# Altium schematic sheet LED_Schematic.SchDoc
size A4; SheetNumber: 1; SheetTotal: 1
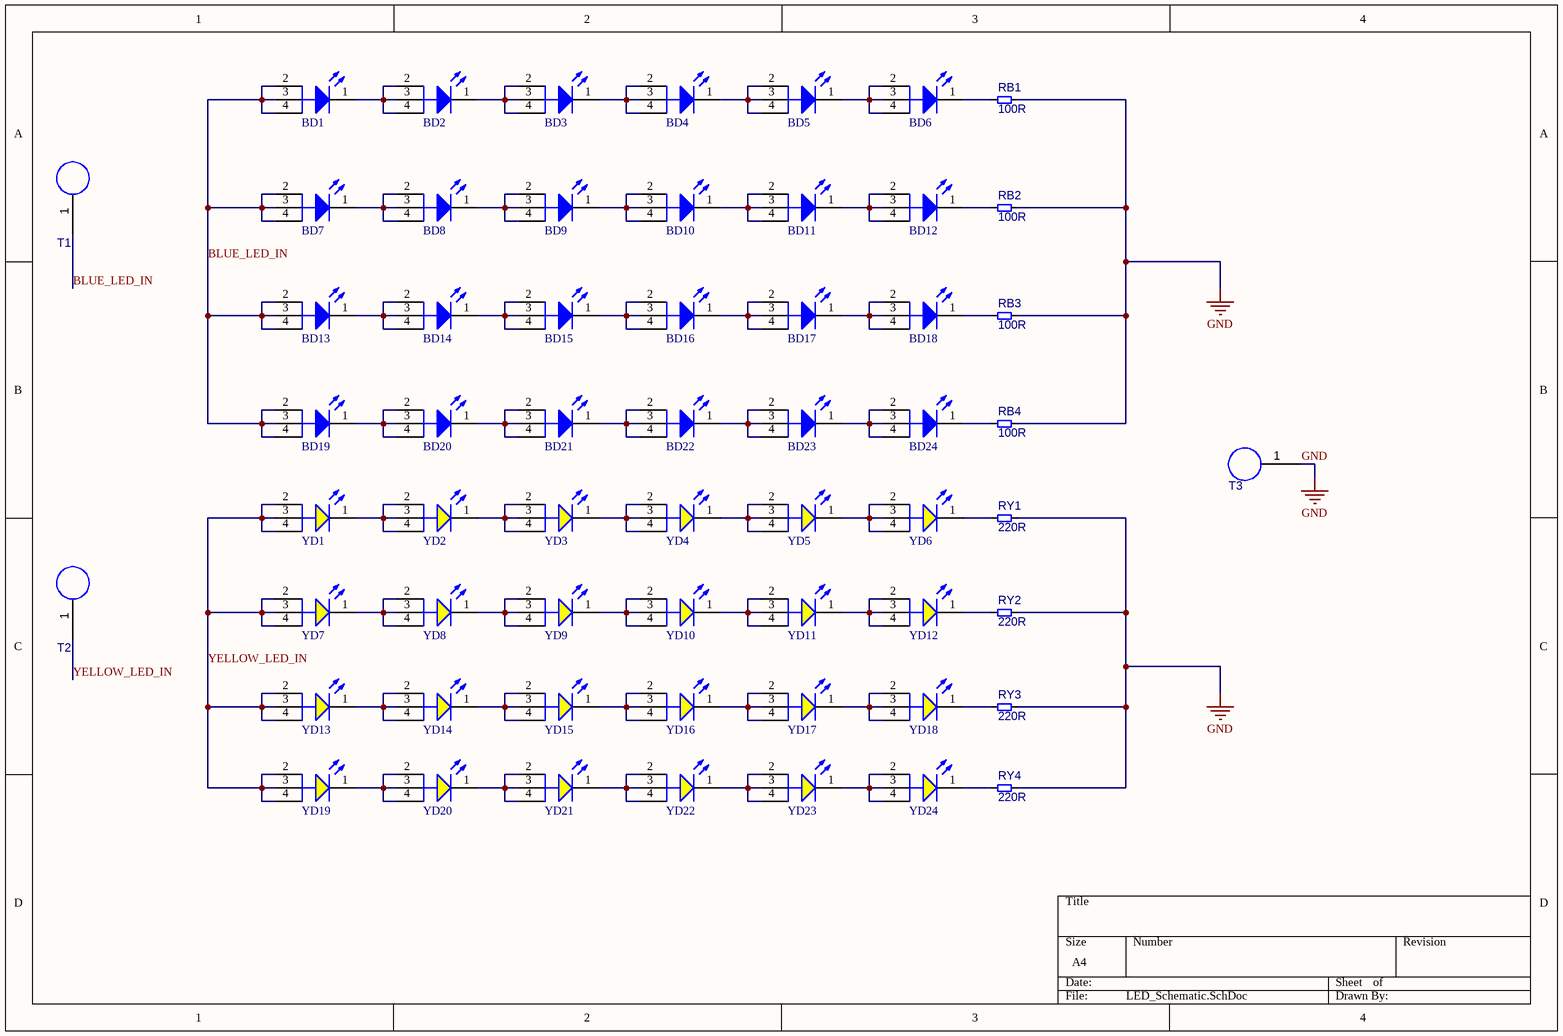
[diagram p0: LED_Schematic.SchDoc]

## Parts
BD1  Blue, 3.2V, 120°  [WL-SMTW_3528_LPCC 4]  (value not drawn)
BD2  Blue, 3.2V, 120°  [WL-SMTW_3528_LPCC 4]  (value not drawn)
BD3  Blue, 3.2V, 120°  [WL-SMTW_3528_LPCC 4]  (value not drawn)
BD4  Blue, 3.2V, 120°  [WL-SMTW_3528_LPCC 4]  (value not drawn)
BD5  Blue, 3.2V, 120°  [WL-SMTW_3528_LPCC 4]  (value not drawn)
BD6  Blue, 3.2V, 120°  [WL-SMTW_3528_LPCC 4]  (value not drawn)
BD7  Blue, 3.2V, 120°  [WL-SMTW_3528_LPCC 4]  (value not drawn)
BD8  Blue, 3.2V, 120°  [WL-SMTW_3528_LPCC 4]  (value not drawn)
BD9  Blue, 3.2V, 120°  [WL-SMTW_3528_LPCC 4]  (value not drawn)
BD10  Blue, 3.2V, 120°  [WL-SMTW_3528_LPCC 4]  (value not drawn)
BD11  Blue, 3.2V, 120°  [WL-SMTW_3528_LPCC 4]  (value not drawn)
BD12  Blue, 3.2V, 120°  [WL-SMTW_3528_LPCC 4]  (value not drawn)
BD13  Blue, 3.2V, 120°  [WL-SMTW_3528_LPCC 4]  (value not drawn)
BD14  Blue, 3.2V, 120°  [WL-SMTW_3528_LPCC 4]  (value not drawn)
BD15  Blue, 3.2V, 120°  [WL-SMTW_3528_LPCC 4]  (value not drawn)
BD16  Blue, 3.2V, 120°  [WL-SMTW_3528_LPCC 4]  (value not drawn)
BD17  Blue, 3.2V, 120°  [WL-SMTW_3528_LPCC 4]  (value not drawn)
BD18  Blue, 3.2V, 120°  [WL-SMTW_3528_LPCC 4]  (value not drawn)
BD19  Blue, 3.2V, 120°  [WL-SMTW_3528_LPCC 4]  (value not drawn)
BD20  Blue, 3.2V, 120°  [WL-SMTW_3528_LPCC 4]  (value not drawn)
BD21  Blue, 3.2V, 120°  [WL-SMTW_3528_LPCC 4]  (value not drawn)
BD22  Blue, 3.2V, 120°  [WL-SMTW_3528_LPCC 4]  (value not drawn)
BD23  Blue, 3.2V, 120°  [WL-SMTW_3528_LPCC 4]  (value not drawn)
BD24  Blue, 3.2V, 120°  [WL-SMTW_3528_LPCC 4]  (value not drawn)
RB1  Resistance: 100R  [2010 (5025)]  (hidden comment: Resistor)
RB2  Resistance: 100R  [2010 (5025)]  (hidden comment: Resistor)
RB3  Resistance: 100R  [2010 (5025)]  (hidden comment: Resistor)
RB4  Resistance: 100R  [2010 (5025)]  (hidden comment: Resistor)
RY1  Resistance: 220R  [2010 (5025)]  (hidden comment: Resistor)
RY2  Resistance: 220R  [2010 (5025)]  (hidden comment: Resistor)
RY3  Resistance: 220R  [2010 (5025)]  (hidden comment: Resistor)
RY4  Resistance: 220R  [2010 (5025)]  (hidden comment: Resistor)
T1  Testpoint_1  [Testpoint_1mm]  (value not drawn)  (no BOM)
T2  Testpoint_2  [Testpoint_1mm]  (value not drawn)  (no BOM)
T3  Testpoint_3  [Testpoint_1mm]  (value not drawn)  (no BOM)
YD1  Yellow, 2.4V, 120°  [WL-SMTW_3528_LPCC 4]  (value not drawn)
YD2  Yellow, 2.4V, 120°  [WL-SMTW_3528_LPCC 4]  (value not drawn)
YD3  Yellow, 2.4V, 120°  [WL-SMTW_3528_LPCC 4]  (value not drawn)
YD4  Yellow, 2.4V, 120°  [WL-SMTW_3528_LPCC 4]  (value not drawn)
YD5  Yellow, 2.4V, 120°  [WL-SMTW_3528_LPCC 4]  (value not drawn)
YD6  Yellow, 2.4V, 120°  [WL-SMTW_3528_LPCC 4]  (value not drawn)
YD7  Yellow, 2.4V, 120°  [WL-SMTW_3528_LPCC 4]  (value not drawn)
YD8  Yellow, 2.4V, 120°  [WL-SMTW_3528_LPCC 4]  (value not drawn)
YD9  Yellow, 2.4V, 120°  [WL-SMTW_3528_LPCC 4]  (value not drawn)
YD10  Yellow, 2.4V, 120°  [WL-SMTW_3528_LPCC 4]  (value not drawn)
YD11  Yellow, 2.4V, 120°  [WL-SMTW_3528_LPCC 4]  (value not drawn)
YD12  Yellow, 2.4V, 120°  [WL-SMTW_3528_LPCC 4]  (value not drawn)
YD13  Yellow, 2.4V, 120°  [WL-SMTW_3528_LPCC 4]  (value not drawn)
YD14  Yellow, 2.4V, 120°  [WL-SMTW_3528_LPCC 4]  (value not drawn)
YD15  Yellow, 2.4V, 120°  [WL-SMTW_3528_LPCC 4]  (value not drawn)
YD16  Yellow, 2.4V, 120°  [WL-SMTW_3528_LPCC 4]  (value not drawn)
YD17  Yellow, 2.4V, 120°  [WL-SMTW_3528_LPCC 4]  (value not drawn)
YD18  Yellow, 2.4V, 120°  [WL-SMTW_3528_LPCC 4]  (value not drawn)
YD19  Yellow, 2.4V, 120°  [WL-SMTW_3528_LPCC 4]  (value not drawn)
YD20  Yellow, 2.4V, 120°  [WL-SMTW_3528_LPCC 4]  (value not drawn)
YD21  Yellow, 2.4V, 120°  [WL-SMTW_3528_LPCC 4]  (value not drawn)
YD22  Yellow, 2.4V, 120°  [WL-SMTW_3528_LPCC 4]  (value not drawn)
YD23  Yellow, 2.4V, 120°  [WL-SMTW_3528_LPCC 4]  (value not drawn)
YD24  Yellow, 2.4V, 120°  [WL-SMTW_3528_LPCC 4]  (value not drawn)

## Nets
GND: RB1.2 RB2.2 RB3.2 RB4.2 RY1.2 RY2.2 RY3.2 RY4.2 T3.1
BLUE_LED_IN: BD1.2(A) BD1.3(A) BD1.4(A) BD7.2(A) BD7.3(A) BD7.4(A) BD13.2(A) BD13.3(A) BD13.4(A) BD19.2(A) BD19.3(A) BD19.4(A) T1.1
YELLOW_LED_IN: T2.1 YD1.2(A) YD1.3(A) YD1.4(A) YD7.2(A) YD7.3(A) YD7.4(A) YD13.2(A) YD13.3(A) YD13.4(A) YD19.2(A) YD19.3(A) YD19.4(A)
NetBD1_1: BD1.1(K) BD2.2(A) BD2.3(A) BD2.4(A)
NetBD2_1: BD2.1(K) BD3.2(A) BD3.3(A) BD3.4(A)
NetBD3_1: BD3.1(K) BD4.2(A) BD4.3(A) BD4.4(A)
NetBD4_1: BD4.1(K) BD5.2(A) BD5.3(A) BD5.4(A)
NetBD5_1: BD5.1(K) BD6.2(A) BD6.3(A) BD6.4(A)
NetBD6_1: BD6.1(K) RB1.1
NetBD7_1: BD7.1(K) BD8.2(A) BD8.3(A) BD8.4(A)
NetBD8_1: BD8.1(K) BD9.2(A) BD9.3(A) BD9.4(A)
NetBD9_1: BD9.1(K) BD10.2(A) BD10.3(A) BD10.4(A)
NetBD10_1: BD10.1(K) BD11.2(A) BD11.3(A) BD11.4(A)
NetBD11_1: BD11.1(K) BD12.2(A) BD12.3(A) BD12.4(A)
NetBD12_1: BD12.1(K) RB2.1
NetBD13_1: BD13.1(K) BD14.2(A) BD14.3(A) BD14.4(A)
NetBD14_1: BD14.1(K) BD15.2(A) BD15.3(A) BD15.4(A)
NetBD15_1: BD15.1(K) BD16.2(A) BD16.3(A) BD16.4(A)
NetBD16_1: BD16.1(K) BD17.2(A) BD17.3(A) BD17.4(A)
NetBD17_1: BD17.1(K) BD18.2(A) BD18.3(A) BD18.4(A)
NetBD18_1: BD18.1(K) RB3.1
NetBD19_1: BD19.1(K) BD20.2(A) BD20.3(A) BD20.4(A)
NetBD20_1: BD20.1(K) BD21.2(A) BD21.3(A) BD21.4(A)
NetBD21_1: BD21.1(K) BD22.2(A) BD22.3(A) BD22.4(A)
NetBD22_1: BD22.1(K) BD23.2(A) BD23.3(A) BD23.4(A)
NetBD23_1: BD23.1(K) BD24.2(A) BD24.3(A) BD24.4(A)
NetBD24_1: BD24.1(K) RB4.1
NetRY1_1: RY1.1 YD6.1(K)
NetRY2_1: RY2.1 YD12.1(K)
NetRY3_1: RY3.1 YD18.1(K)
NetRY4_1: RY4.1 YD24.1(K)
NetYD1_1: YD1.1(K) YD2.2(A) YD2.3(A) YD2.4(A)
NetYD2_1: YD2.1(K) YD3.2(A) YD3.3(A) YD3.4(A)
NetYD3_1: YD3.1(K) YD4.2(A) YD4.3(A) YD4.4(A)
NetYD4_1: YD4.1(K) YD5.2(A) YD5.3(A) YD5.4(A)
NetYD5_1: YD5.1(K) YD6.2(A) YD6.3(A) YD6.4(A)
NetYD7_1: YD7.1(K) YD8.2(A) YD8.3(A) YD8.4(A)
NetYD8_1: YD8.1(K) YD9.2(A) YD9.3(A) YD9.4(A)
NetYD9_1: YD9.1(K) YD10.2(A) YD10.3(A) YD10.4(A)
NetYD10_1: YD10.1(K) YD11.2(A) YD11.3(A) YD11.4(A)
NetYD11_1: YD11.1(K) YD12.2(A) YD12.3(A) YD12.4(A)
NetYD13_1: YD13.1(K) YD14.2(A) YD14.3(A) YD14.4(A)
NetYD14_1: YD14.1(K) YD15.2(A) YD15.3(A) YD15.4(A)
NetYD15_1: YD15.1(K) YD16.2(A) YD16.3(A) YD16.4(A)
NetYD16_1: YD16.1(K) YD17.2(A) YD17.3(A) YD17.4(A)
NetYD17_1: YD17.1(K) YD18.2(A) YD18.3(A) YD18.4(A)
NetYD19_1: YD19.1(K) YD20.2(A) YD20.3(A) YD20.4(A)
NetYD20_1: YD20.1(K) YD21.2(A) YD21.3(A) YD21.4(A)
NetYD21_1: YD21.1(K) YD22.2(A) YD22.3(A) YD22.4(A)
NetYD22_1: YD22.1(K) YD23.2(A) YD23.3(A) YD23.4(A)
NetYD23_1: YD23.1(K) YD24.2(A) YD24.3(A) YD24.4(A)

## Library data of the parts
BD1-BD24 = 150141BS73140: WL-SMTW Mono-color TOP LED Waterclear, size 3528, Blue, 3.2V, 120°; Manufacturer: Wurth Elektronik; Case/Size Code: 3528; Chip Technology: InGaN; Dominant Wavelength: 470nm; Luminous Intensity: 1000mcd; Peak Wavelength: 465nm; Manufacturer Part Number: 150141BS73140; Category: Signal LEDs; Match Code: WL-SMTW; ComponentLink1Description: Website Link; ComponentLink1URL: https://www.we-online.com/redexpert/article/150141BS73140?ad; ComponentLink2Description: Datasheet Link; ComponentLink2URL: https://www.we-online.com/redexpert/spec/150141BS73140?ad; Mount: Surface Mount; Operating Temperature Max: 85°C; Operating Temperature Min: -40°C; Packaging: Tape and Reel; Length: 3.5mm; Width: 2.8mm; Height: 1.85mm; Emitting Color: Blue; Forward Voltage: 3.2V; Viewing Angle: 120°
RB1-RB4 RY1-RY4 = RES-Std: General resistor; Tolerance: *%; Power (W): *; Manufacturer P/N: *; Current (A): *; Type: *; Voltage (V): *; Manufacturer: *; Capacitance: *
  RB1-RB4: Value: =100R
  RY1-RY4: Value: =220R
T1-T3 = Testpoint_1: Testpoint
YD1-YD24 = 150141YS73140: WL-SMTW Mono-color TOP LED Waterclear, size 3528, Yellow, 2.4V, 120°; Manufacturer: Wurth Elektronik; Case/Size Code: 3528; Chip Technology: AlInGaP; Dominant Wavelength: 590nm; Luminous Intensity: 2000mcd; Peak Wavelength: 592nm; Manufacturer Part Number: 150141YS73140; Category: Signal LEDs; Match Code: WL-SMTW; ComponentLink1Description: Website Link; ComponentLink1URL: https://www.we-online.com/redexpert/article/150141YS73140?ad; ComponentLink2Description: Datasheet Link; ComponentLink2URL: https://www.we-online.com/redexpert/spec/150141YS73140?ad; Mount: Surface Mount; Operating Temperature Max: 85°C; Operating Temperature Min: -40°C; Packaging: Tape and Reel; Length: 3.5mm; Width: 2.8mm; Height: 1.85mm; Emitting Color: Yellow; Forward Voltage: 2.4V; Viewing Angle: 120°